# Altium project gaynguoimu.PrjPcb
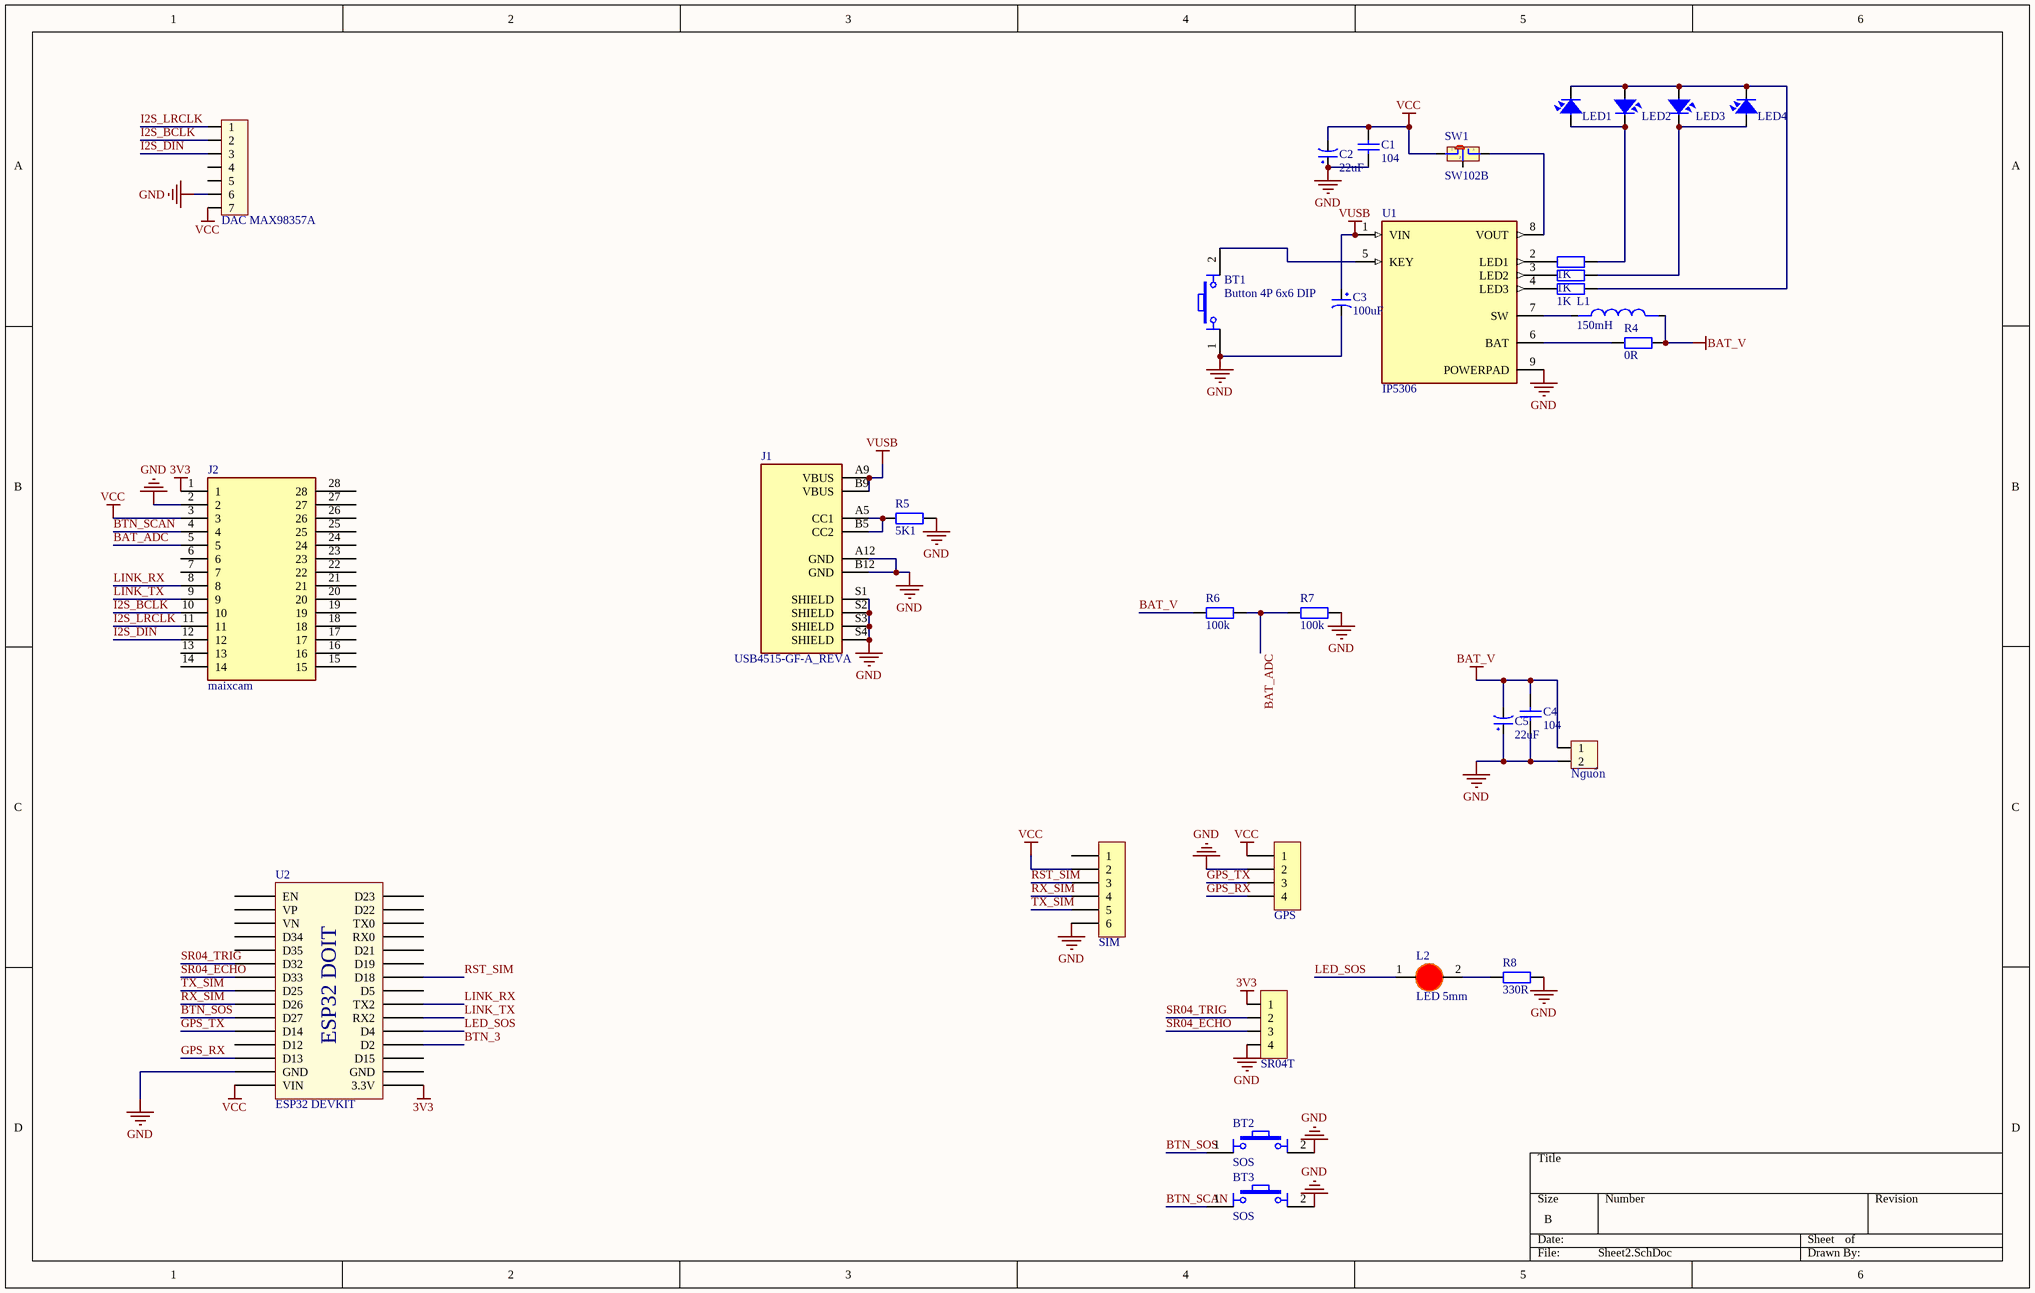
[diagram p0: Sheet2.SchDoc]
1 sheet, 32 parts. Net scope: global (net labels, ports and power ports of the same name join across sheets).
Board file: PCB3.PcbDoc

## Sheet Sheet2.SchDoc
size B; SheetNumber: 1; SheetTotal: 1

### Parts
BT1  Button 4P 6x6 DIP  [Nut Nhan 4 Chan Cam 6x6]
BT2  SOS  [Nut Nhan 4 Chan Cam 6x6]
BT3  SOS  [Nut Nhan 4 Chan Cam 6x6]
C1  104  [tu gom]
C2  22uF  [tu hoa 4mm]
C3  100uF  [tu hoa 5mm]
C4  104  [tu gom]
C5  22uF  [tu hoa 4mm]
H1  DAC MAX98357A  [XH2.54M-7]
H2  Nguồn  [XH2.54M-2]
H3  SIM  [XH2.54M-6]
H4  GPS  [Header 4P DC 2.54]
J1  USB4515-GF-A_REVA  [GCT_USB4515-GF-A_REVA]
J2  maixcam  [TE_5104338-2]
JP1  SR04T  [JP 1x4 DT]
L1  150mH  [CUON CAM SMD 0530]
L2  LED 5mm  [LED-5MM-RED]
LED1  LED SMD  [SM-LED-0805-Blue]  (value not drawn)
LED2  LED SMD  [SM-LED-0805-Blue]  (value not drawn)
LED3  LED SMD  [SM-LED-0805-Blue]  (value not drawn)
LED4  LED SMD  [SM-LED-0805-Blue]  (value not drawn)
R1  1K  [tro smd 0805]
R2  1K  [tro smd 0805]
R3  1K  [tro smd 0805]
R4  0R  [tro smd 0805]
R5  5K1  [tro smd 0805]
R6  100k  [tro smd 0805]
R7  100k  [tro smd 0805]
R8  330R  [tro vach 1/4w]
SW1  SW102B  [SW-GAT]
U1  IP5306  [SOP127P600X165-9N]
U2  ESP32 DEVKIT  [ESP32 WROOM 32 KIT]

### Nets
3V3: J2.1 JP1.1 U2.16(3.3V)
BAT_V: C4.1 C5.2 H2.1 L1.2 R4.1 R6.1
GND: BT1.1 BT2.2 BT3.2 C1.2 C2.1 C3.2 C4.2 C5.1 H1.6 H2.2 H3.6 H4.2 J1.A12(GND) J1.B12(GND) J1.S1(SHIELD) J1.S2(SHIELD) J1.S3(SHIELD) J1.S4(SHIELD) J2.2 JP1.4 R5.2 R7.2 R8.2 U1.9(POWERPAD) U2.14(GND)
VCC: C1.1 C2.2 H1.7 H3.2 H4.1 J2.3 SW1.1 U2.15(VIN)
VUSB: C3.1 J1.A9(VBUS) J1.B9(VBUS) U1.1(VIN)
BAT_ADC: J2.5 R6.2 R7.1
BTN_3: U2.19(D2)
BTN_SCAN: BT3.1 J2.4
BTN_SOS: BT2.1 U2.10(D27)
GPS_RX: H4.4 U2.13(D13)
GPS_TX: H4.3 U2.11(D14)
I2S_BCLK: H1.2 J2.10
I2S_DIN: H1.3 J2.12
I2S_LRCLK: H1.1 J2.11
LED_SOS: L2.1(A) U2.20(D4)
LINK_RX: J2.8 U2.22(TX2)
LINK_TX: J2.9 U2.21(RX2)
RST_SIM: H3.3 U2.24(D18)
RX_SIM: H3.4 U2.9(D26)
SR04_ECHO: JP1.3 U2.7(D33)
SR04_TRIG: JP1.2 U2.6(D32)
TX_SIM: H3.5 U2.8(D25)
NetBT1_2: BT1.2 U1.5(KEY)
NetJ1_A5: J1.A5(CC1) J1.B5(CC2) R5.1
NetL1_1: L1.1 U1.7(SW)
NetL2_2: L2.2(K) R8.1
NetLED1_1: LED1.1 LED2.2 R1.1
NetLED1_2: LED1.2 LED2.1 LED3.1 LED4.2 R3.1
NetLED3_2: LED3.2 LED4.1 R2.1
NetR1_2: R1.2 U1.2(LED1)
NetR2_2: R2.2 U1.3(LED2)
NetR3_2: R3.2 U1.4(LED3)
NetR4_2: R4.2 U1.6(BAT)
NetSW1_3: SW1.3 U1.8(VOUT)

Not connected (* = marked no-connect by the designer): H1 4 5; H3 1; J2 6 7 13 14 15 16 17 18 19 20 21 22 23 24 25 26 27 28; SW1 2; U2 1(EN) 2(VP) 3(VN) 4(D34) 5(D35) 12(D12) 17(GND) 18(D15) 23(D5) 25(D19) 26(D21) 27(RX0) 28(TX0) 29(D22) 30(D23)

### Notes on the sheet
- (in symbol ESP32 WROOM 32 KIT) ESP32 DOIT

### Library data of the parts
BT1 = Button 4P 6x6 DIP: Button 4pin 6x6 DIP; Ten: Nút Nhấn 4 Chân 6x6x5MM DIP; Ma_Hang: MH004584
BT2 BT3 = Nut Nhan 4 Chan Cam 6x6: Nut Nhan 4 Chan 6x6mm; Ten: Nút Nh?n 4 Chân 6x6x5MM DIP; Ma_Hang: MH004584
C1 = Tu gom 104 50V: C?m; So_Chan: 2; Ten_Linh_Kien: T? g?m 104 100nF 50V; Don_Vi: Con; Ma_Hang: MH004761; Chung_Loai: C?m; Kieu_Chan: *
C2 = Tu Hoa 22uF 16V 4x7: C?m; Don_Vi: Con; So_Chan: 2; Ten_Linh_Kien: T? Hóa 22uF 16V; Ma_Hang: MH006857; Chung_Loai: C?m; Kieu_Chan: *
C3 = Tu Hoa 100uF 16V 5x11: Cắm; Don_Vi: Con; So_Chan: 2; Ten_Linh_Kien: Tụ Hóa 100uF 16V 5x11MM; Ma_Hang: MH008417; Chung_Loai: Cắm; Kieu_Chan: *
C4 = Tu gom 104 50V: Cắm; So_Chan: 2; Ten_Linh_Kien: Tụ gốm 104 100nF 50V; Don_Vi: Con; Ma_Hang: MH004761; Chung_Loai: Cắm; Kieu_Chan: *
C5 = Tu Hoa 22uF 16V 4x7: Cắm; Don_Vi: Con; So_Chan: 2; Ten_Linh_Kien: Tụ Hóa 22uF 16V; Ma_Hang: MH006857; Chung_Loai: Cắm; Kieu_Chan: *
H1 = Header 7P 2.54 Duc Thang: C?m; Ten_Linh_Kien: Header 7P XH2.54-7P Ð?c Th?ng; Don_Vi: Con; Ma_Hang: MH003369; Chung_Loai: C?m
H2 = Header 2P 2.54 Duc Thang: C?m; Ten_Linh_Kien: Header 2P XH2.54-2P Ð?c Th?ng; Don_Vi: Con; Ma_Hang: MH001283; Chung_Loai: C?m
H3 = Header 6P 2.54 Duc Thang: C?m; Ten_Linh_Kien: Header 6P XH2.54-6P Ð?c Th?ng; Don_Vi: Con; Ma_Hang: MH001972; Chung_Loai: C?m
H4 = Header 4P 2.54 Duc Cong: C?m; Ten_Linh_Kien: Header 4P XH2.54-4P Ð?c Cong; Don_Vi: Con; Ma_Hang: MH001310; Chung_Loai: C?m
J1 = USB4515-GF-A_REVA: Type C USB Charging Connector; MF: Global Connector Technology; SnapEDA_Link: https://www.snapeda.com/parts/USB4515-GF-A/Global+Connector+Technology/view-part/?ref=snap; Package: None; Check_prices: https://www.snapeda.com/parts/USB4515-GF-A/Global+Connector+Technology/view-part/?ref=eda; Value: *; Digi-Key_Part_Number: 2073-USB4515-GF-ATR-ND; MP: USB4515-GF-A
J2 = 5104338-2: HEADER, PIN, AMP-LATCH, 14 POS, 2.54 X 2.54, VERTICAL, LOW PROFILE, PCB; MF: TE Connectivity; SnapEDA_Link: https://www.snapeda.com/parts/5104338-2/TE+Connectivity+AMP+Connectors/view-part/?ref=snap; Package: None; Value: *; MP: 5104338-2; EU_RoHS_Compliance: Compliant; Check_prices: https://www.snapeda.com/parts/5104338-2/TE+Connectivity+AMP+Connectors/view-part/?ref=eda
JP1 = JP 1x4 2.54 Duc Thang: C?m; Ten_Linh_Kien: Jump Ðon Ð?c 2.54MM 1x40P Th?ng 11MM; Don_Vi: Con; Ma_Hang: MH000903; Ghi_Chu: *; Kieu_Chan: *; Chung_Loai: C?m
L1 = Cuon Cam SMD 0530: SMD 0530; MP: FDV0530-H-1R5M=P3; Package: None; Price: None; Value: *; Availability: Unavailable
L2 = LED 5mm Do: C?m; Don_Vi: Con; Ma_Hang: MH008967; Ten_Linh_Kien: Led 5MM Ph? Ð? (1000c); Ghi_Chu: *; Kieu_Chan: *; Chung_Loai: C?m
LED1-LED4 = LED-SMD-0805
R1-R5 = R1/4W: Resistor 1/4W; Value: R1/4W - 1K
R6 R7 = Tro 0805 5% 100k: Dán; Don_Vi: Con; So_Chan: 2; Ten_Linh_Kien: Tr? 0805 5% 100k; Ma_Hang: MH005250; Chung_Loai: Dán; Kieu_Chan: *
R8 = Tro Vach 1/4W 5% 330R: C?m; Don_Vi: Con; So_Chan: 2; Ten_Linh_Kien: Tr? V?ch 1/4W 5% 330R; Ma_Hang: MH007436; Chung_Loai: C?m; Kieu_Chan: *
SW1 = SW102B: Switch 102 on Broad; Value: Switch 102 On Board
U1 = IP5306: Fully-Integrated Power Bank System-On-Chip with 2.1A charger, 2.4A discharger; MF: Injoinic; SnapEDA_Link: https://www.snapeda.com/parts/IP5306/Injoinic/view-part/?ref=snap; Package: SOIC-4 INJOINIC; Value: *; MP: IP5306; Check_prices: https://www.snapeda.com/parts/IP5306/Injoinic/view-part/?ref=eda
U2 = ESP32 WROOM 32 KIT